# Altium schematic sheet Sheet_Diagrama.SchDoc
size A4; SheetNumber: 1; SheetTotal: 7
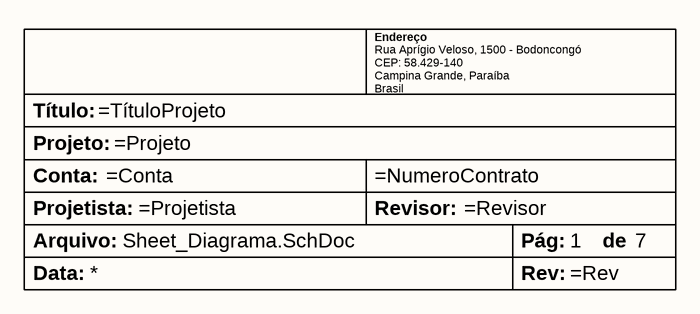
[diagram p0: Sheet_Diagrama.SchDoc]

## Parts
TB?  Title Block  (value not drawn)  (graphical)

## Notes on the sheet
- (in symbol Title Block) Endereço; Título:; Rua Aprígio Veloso, 1500 - Bodoncongó / CEP: 58.429-140 / Campina Grande, Paraíba / Brasil; Projeto:; Conta:; Projetista:; Revisor:; Arquivo:; Pág:; de; Data:; Rev: